# Altium schematic sheet Top_Sheet.SchDoc
size A4; DocumentNumber: 4; SheetNumber: 1; SheetTotal: 4
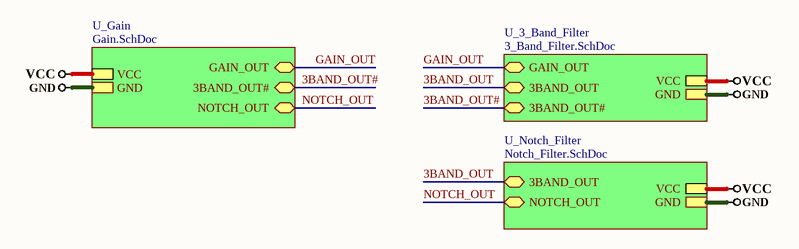
[diagram p0: Top_Sheet.SchDoc]

## Sub-sheets
U_3_Band_Filter = 3_Band_Filter.SchDoc: GAIN_OUT (bidir), 3BAND_OUT (bidir), GND, VCC, 3BAND_OUT# (bidir)
U_Gain = Gain.SchDoc: GND, VCC, GAIN_OUT (bidir), NOTCH_OUT (bidir), 3BAND_OUT# (bidir)
U_Notch_Filter = Notch_Filter.SchDoc: GND, VCC, 3BAND_OUT (bidir), NOTCH_OUT (bidir)

## Nets
GND: sheet U_Notch_Filter/GND, sheet U_3_Band_Filter/GND, sheet U_Gain/GND
VCC: sheet U_Notch_Filter/VCC, sheet U_3_Band_Filter/VCC, sheet U_Gain/VCC
3BAND_OUT: sheet U_Notch_Filter/3BAND_OUT, sheet U_3_Band_Filter/3BAND_OUT
3BAND_OUT#: sheet U_3_Band_Filter/3BAND_OUT#, sheet U_Gain/3BAND_OUT#
GAIN_OUT: sheet U_3_Band_Filter/GAIN_OUT, sheet U_Gain/GAIN_OUT
NOTCH_OUT: sheet U_Notch_Filter/NOTCH_OUT, sheet U_Gain/NOTCH_OUT

## Notes on the sheet
- File:
- Title:
- Date:
- Page
- Num:
- Total:
- Drawn By: Huzaifa Ali